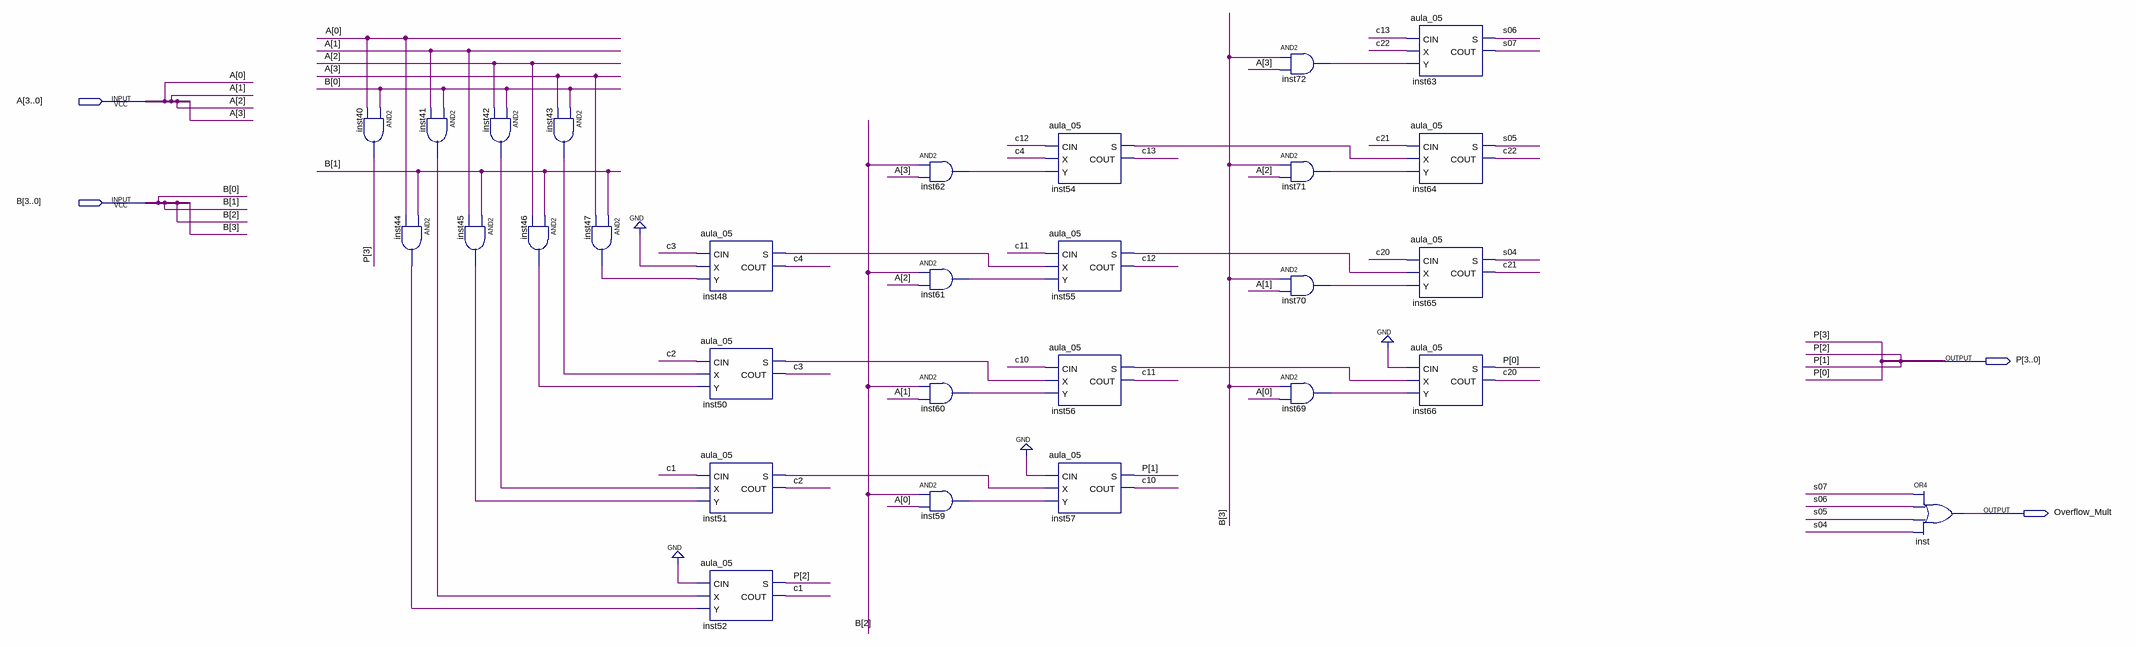
[diagram p0: schematic sheet]
// Quartus schematic aula_10.bdf as structural Verilog: 29 symbols, 4 pins
module aula_10 (
  input  [3:0] A,
  input  [3:0] B,
  output [3:0] P,
  output Overflow_Mult
);

  wire c1, c2, c3, c4, c10, c11, c12, c13, c20, c21, c22, inst41_out, inst42_out, inst43_out, inst44_out,
       inst45_out, inst46_out, inst47_out, inst48_s, inst50_s, inst51_s, inst54_s, inst55_s, inst56_s,
       inst59_out, inst60_out, inst61_out, inst62_out, inst69_out, inst70_out, inst71_out, inst72_out, s04,
       s05, s06, s07;

  and inst40 (P[3], B[0], A[0]);
  and inst44 (inst44_out, B[1], A[0]);
  and inst41 (inst41_out, B[0], A[1]);
  and inst45 (inst45_out, B[1], A[1]);
  and inst42 (inst42_out, B[0], A[2]);
  and inst43 (inst43_out, B[0], A[3]);
  and inst46 (inst46_out, B[1], A[2]);
  and inst47 (inst47_out, B[1], A[3]);
  aula_05 inst48 (.CIN(c3), .X(1'b0), .Y(inst47_out), .S(inst48_s), .COUT(c4));
  aula_05 inst50 (.CIN(c2), .X(inst43_out), .Y(inst46_out), .S(inst50_s), .COUT(c3));
  aula_05 inst51 (.CIN(c1), .X(inst42_out), .Y(inst45_out), .S(inst51_s), .COUT(c2));
  aula_05 inst52 (.CIN(1'b0), .X(inst41_out), .Y(inst44_out), .S(P[2]), .COUT(c1));
  and inst62 (inst62_out, B[2], A[3]);
  and inst61 (inst61_out, B[2], A[2]);
  and inst60 (inst60_out, B[2], A[1]);
  and inst59 (inst59_out, B[2], A[0]);
  aula_05 inst54 (.CIN(c12), .X(c4), .Y(inst62_out), .S(inst54_s), .COUT(c13));
  aula_05 inst55 (.CIN(c11), .X(inst48_s), .Y(inst61_out), .S(inst55_s), .COUT(c12));
  aula_05 inst56 (.CIN(c10), .X(inst50_s), .Y(inst60_out), .S(inst56_s), .COUT(c11));
  aula_05 inst57 (.CIN(1'b0), .X(inst51_s), .Y(inst59_out), .S(P[1]), .COUT(c10));
  and inst72 (inst72_out, B[3], A[3]);
  and inst71 (inst71_out, B[3], A[2]);
  and inst70 (inst70_out, B[3], A[1]);
  and inst69 (inst69_out, B[3], A[0]);
  aula_05 inst63 (.CIN(c13), .X(c22), .Y(inst72_out), .S(s06), .COUT(s07));
  aula_05 inst64 (.CIN(c21), .X(inst54_s), .Y(inst71_out), .S(s05), .COUT(c22));
  aula_05 inst65 (.CIN(c20), .X(inst55_s), .Y(inst70_out), .S(s04), .COUT(c21));
  aula_05 inst66 (.CIN(1'b0), .X(inst56_s), .Y(inst69_out), .S(P[0]), .COUT(c20));
  or inst (Overflow_Mult, s07, s06, s05, s04);
endmodule
